# EAGLE design motortester (EAGLE 9.6.0)
REVISION: v1.0; TEAM: RoboCup SSL

## Sheet 1 of 2: Microcontroller and connectors
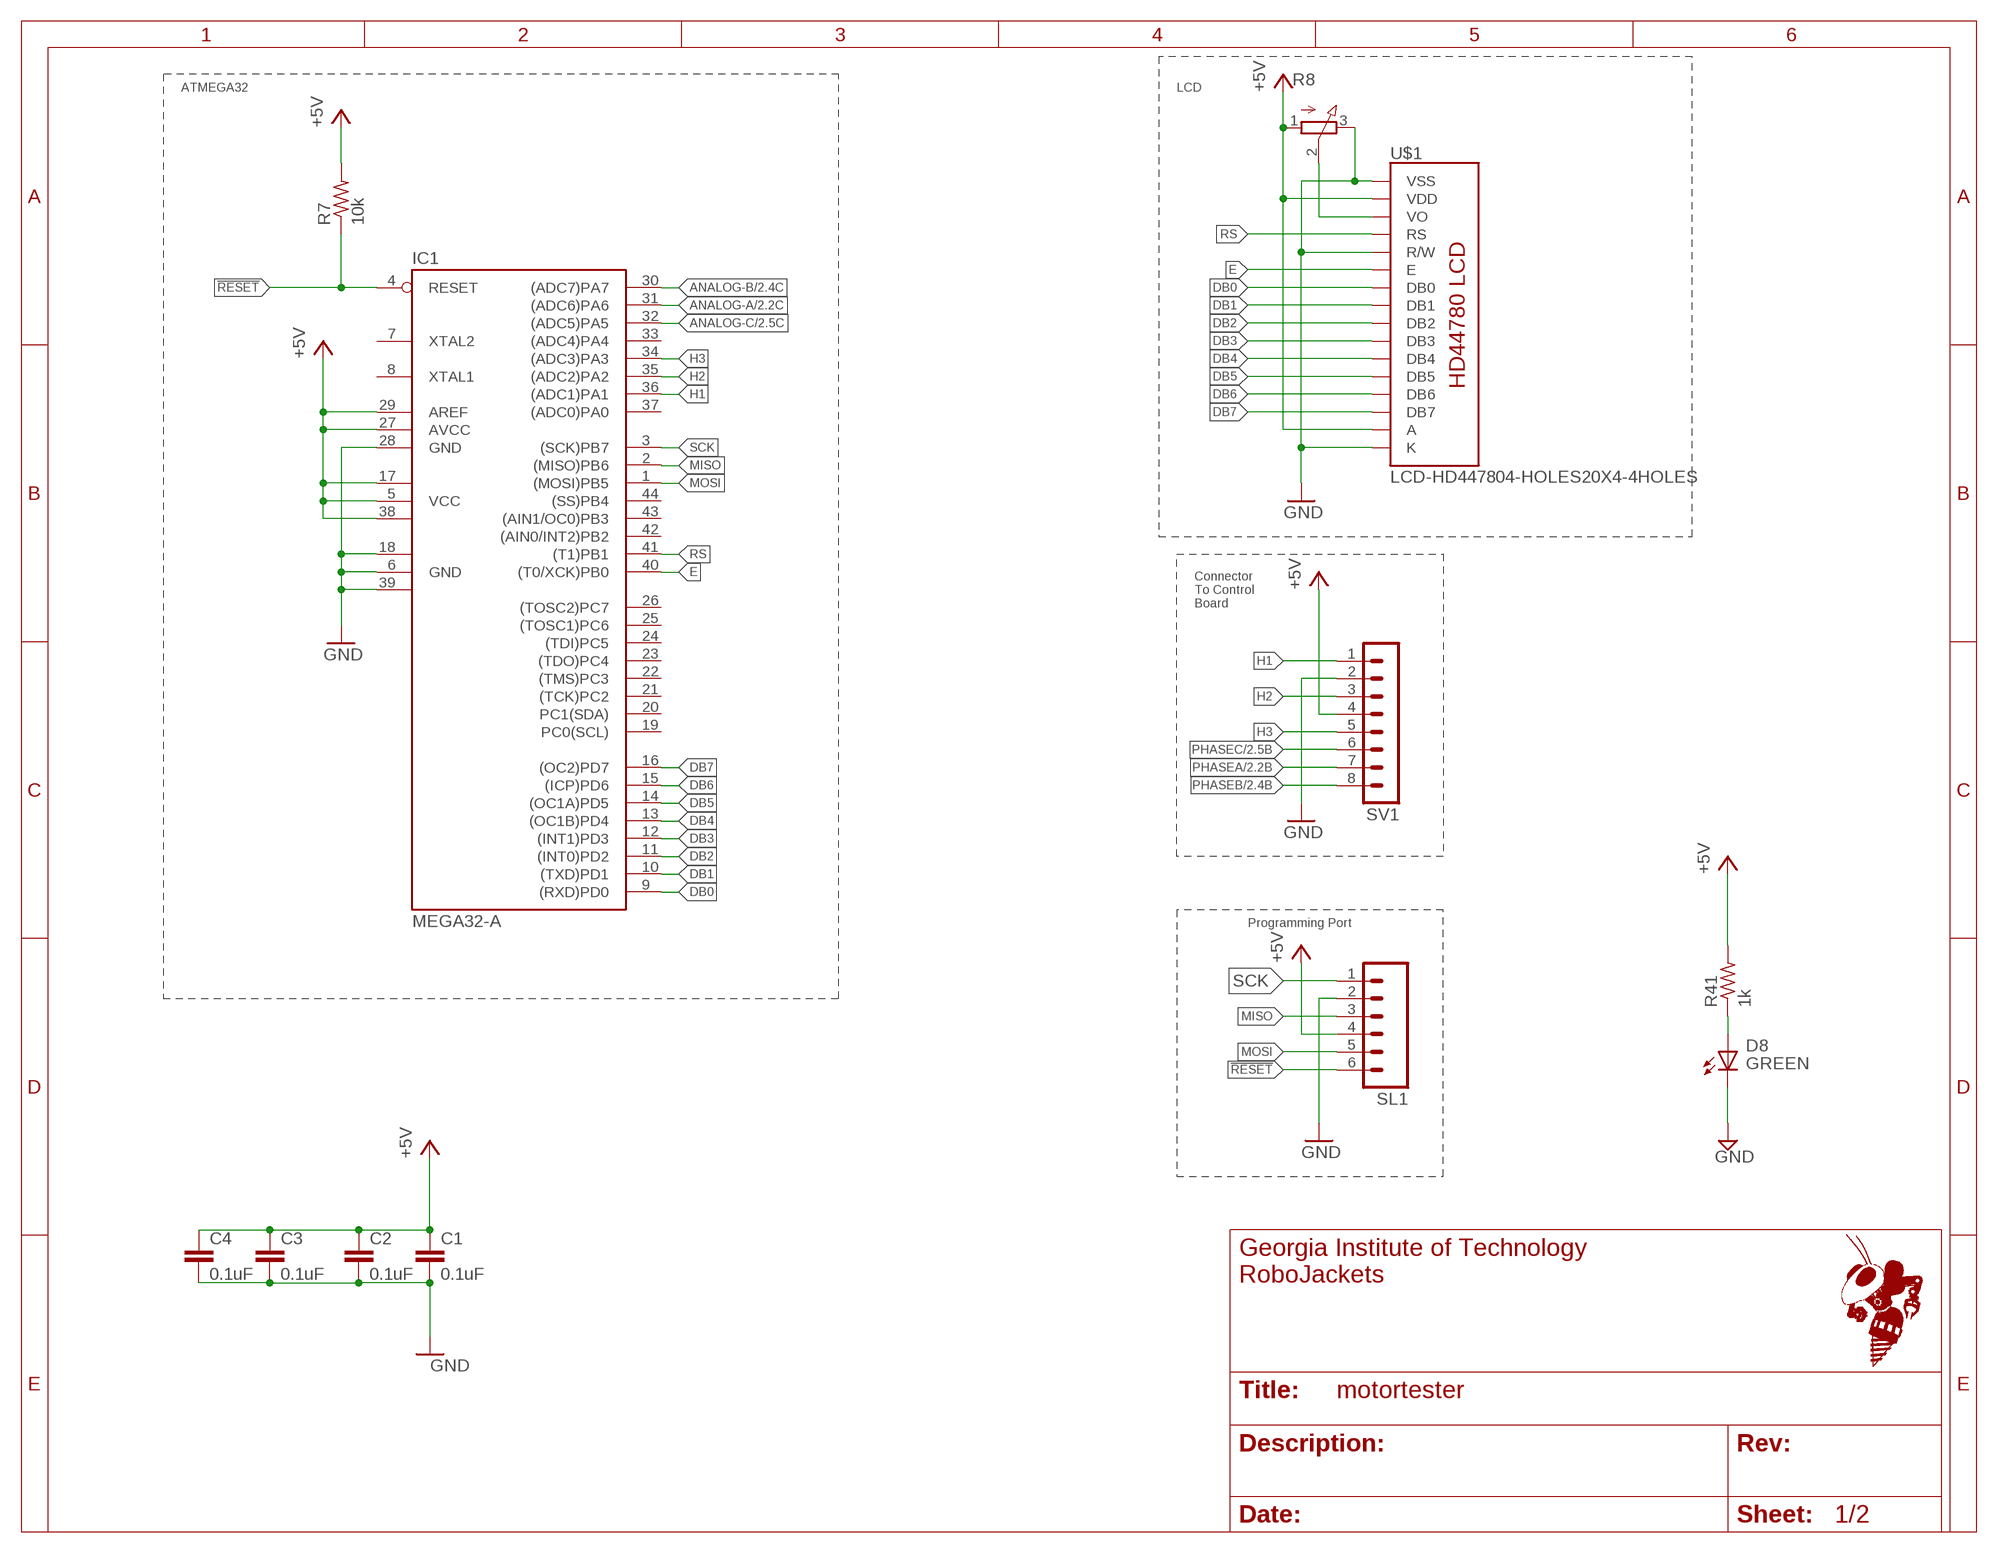
[diagram p0: schematic, sheet 1]

### Parts
C1  0.1uF  C-EUC0603  [C0603]
C2  0.1uF  C-EUC0603  [C0603]
C3  0.1uF  C-EUC0603  [C0603]
C4  0.1uF  C-EUC0603  [C0603]
D8  GREEN  LED-SMD-GREEN  [CHIP-LED0603]
IC1  MEGA32-A  [TQFP44]
R7  10k  R-US_R0603  [R0603]
R8  3RP/1610N  [3RP/1610N]
R41  1k  R-US_R0603  [R0603]
SL1  M06  [06P]
SV1  MA08-1  [MA08-1]
U$1  LCD-HD447804-HOLES20X4-4HOLES  [LCD-20X4-4HOLES]

### Nets
5V_PWR_BR: D8.A R41.1
!RESET!: IC1.4(RESET) R7.1 SL1.6
ANALOG-A: IC1.31((ADC6)PA6) ; also sheet 2
ANALOG-B: IC1.30((ADC7)PA7) ; also sheet 2
ANALOG-C: IC1.32((ADC5)PA5) ; also sheet 2
DB0: IC1.9((RXD)PD0) U$1.P$7(DB0)
DB1: IC1.10((TXD)PD1) U$1.P$8(DB1)
DB2: IC1.11((INT0)PD2) U$1.P$9(DB2)
DB3: IC1.12((INT1)PD3) U$1.P$10(DB3)
DB4: IC1.13((OC1B)PD4) U$1.P$11(DB4)
DB5: IC1.14((OC1A)PD5) U$1.P$12(DB5)
DB6: IC1.15((ICP)PD6) U$1.P$13(DB6)
DB7: IC1.16((OC2)PD7) U$1.P$14(DB7)
E: IC1.40((T0/XCK)PB0) U$1.P$6(E)
GND: C1.2 C2.2 C3.2 C4.2 D8.C(K) IC1.6(GND) IC1.18(GND1) IC1.28(GND) IC1.39(GND2) R8.3(E) SL1.2 SV1.2 U$1.P$1(VSS) U$1.P$5(R/W) U$1.P$16(K)
H1: IC1.36((ADC1)PA1) SV1.1
H2: IC1.35((ADC2)PA2) SV1.3
H3: IC1.34((ADC3)PA3) SV1.5
MISO: IC1.2((MISO)PB6) SL1.3
MOSI: IC1.1((MOSI)PB5) SL1.5
N$4: R8.2(S) U$1.P$3(VO)
PHASEA: SV1.7 ; also sheet 2
PHASEB: SV1.8 ; also sheet 2
PHASEC: SV1.6 ; also sheet 2
RS: IC1.41((T1)PB1) U$1.P$4(RS)
SCK: IC1.3((SCK)PB7) SL1.1
VCC: C1.1 C2.1 C3.1 C4.1 IC1.5(VCC) IC1.17(VCC1) IC1.27(AVCC) IC1.29(AREF) IC1.38(VCC2) R7.2 R8.1(A) R41.2 SL1.4 SV1.4 U$1.P$2(VDD) U$1.P$15(A) ; supply symbol labelled +5V ; also sheet 2
Unconnected: IC1.7(XTAL2) IC1.8(XTAL1) IC1.19(PC0(SCL)) IC1.20(PC1(SDA)) IC1.21((TCK)PC2) IC1.22((TMS)PC3) IC1.23((TDO)PC4) IC1.24((TDI)PC5) IC1.25((TOSC1)PC6) IC1.26((TOSC2)PC7) IC1.33((ADC4)PA4) IC1.37((ADC0)PA0) IC1.42((AIN0/INT2)PB2) IC1.43((AIN1/OC0)PB3) IC1.44((SS)PB4)

### Notes on the sheet
- ATMEGA32 | LCD
- Connector
  To Control
  Board
- Programming Port

## Sheet 2 of 2: Resistor network
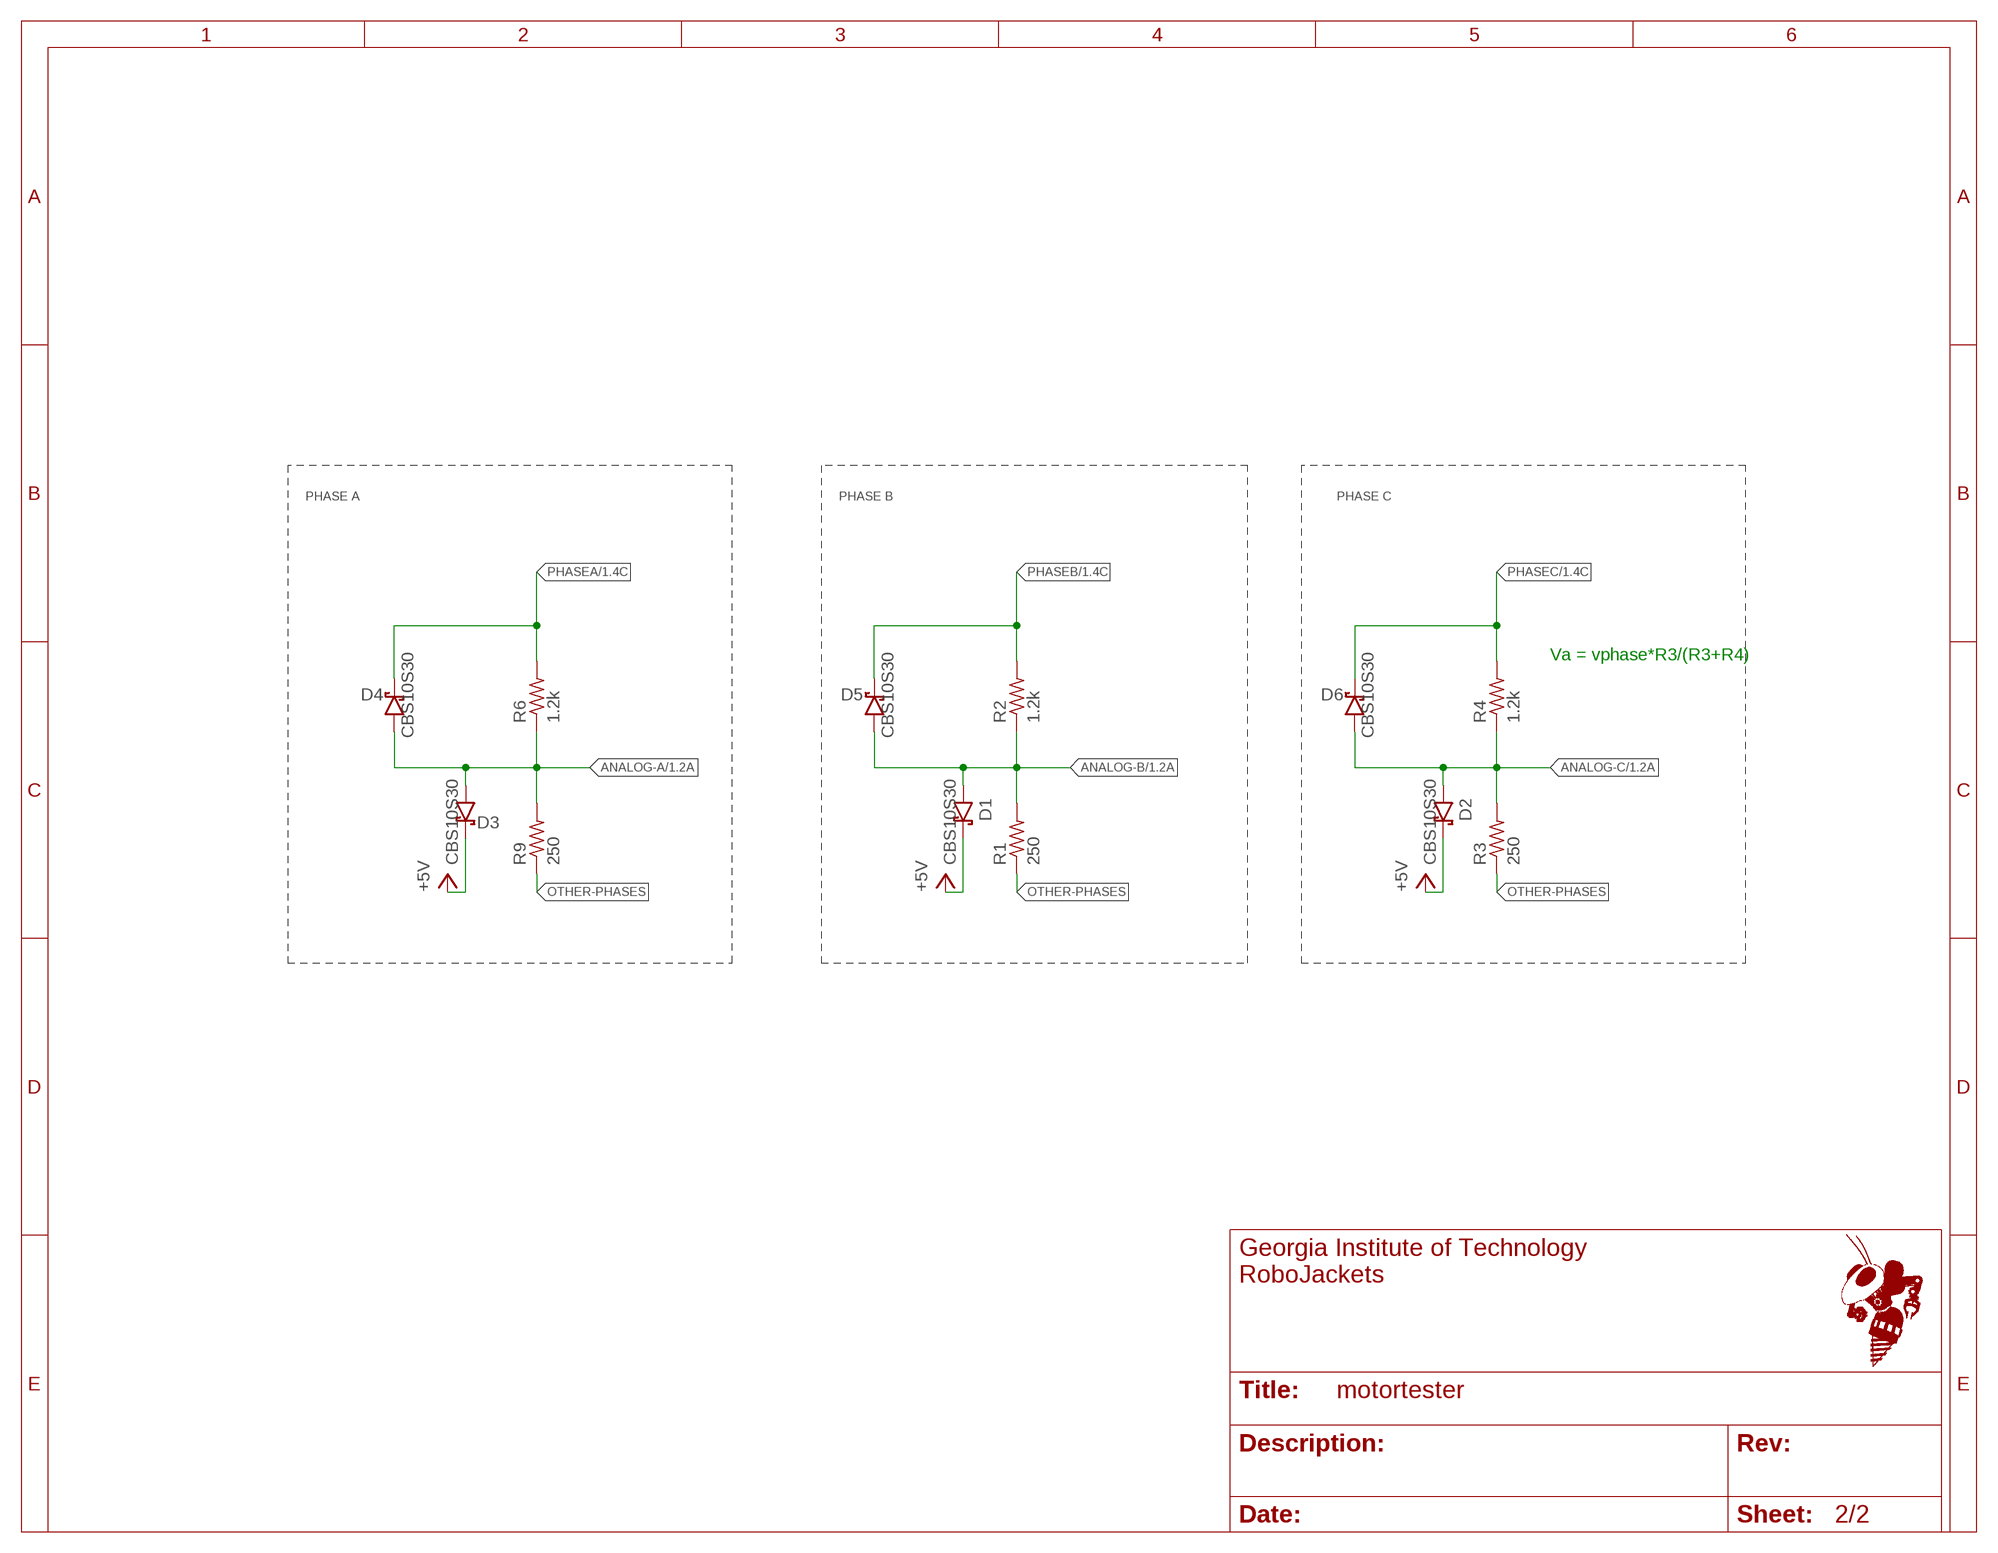
[diagram p1: schematic, sheet 2]

### Parts
D1  CBS10S30  [CST2B]
D2  CBS10S30  [CST2B]
D3  CBS10S30  [CST2B]
D4  CBS10S30  [CST2B]
D5  CBS10S30  [CST2B]
D6  CBS10S30  [CST2B]
R1  250  R-US_R0603  [R0603]
R2  1.2k  R-US_R1206  [R1206]
R3  250  R-US_R0603  [R0603]
R4  1.2k  R-US_R1206  [R1206]
R6  1.2k  R-US_R1206  [R1206]
R9  250  R-US_R0603  [R0603]

### Nets
ANALOG-A: D3.A D4.A R6.1 R9.2 ; also sheet 1
ANALOG-B: D1.A D5.A R1.2 R2.1 ; also sheet 1
ANALOG-C: D2.A D6.A R3.2 R4.1 ; also sheet 1
OTHER-PHASES: R1.1 R3.1 R9.1
PHASEA: D4.K(C) R6.2 ; also sheet 1
PHASEB: D5.K(C) R2.2 ; also sheet 1
PHASEC: D6.K(C) R4.2 ; also sheet 1
VCC: D1.K(C) D2.K(C) D3.K(C) ; supply symbol labelled +5V ; also sheet 1

### Notes on the sheet
- PHASE A | PHASE B | PHASE C
- Va = vphase*R3/(R3+R4)

## Library data of the parts
C1-C4 = rcl:C-EU: CAPACITOR, European symbol; SPICEPREFIX: C
D1-D6 = RoboJackets-Diodes:CBS10S30
D8 = RoboJackets-LEDs:LED-SMD; DIGIKEY: 160-1446-1-ND; MPN: LTST-C191KGKT
IC1 = atmel:MEGA32: MICROCONTROLLER 32 Kbytes FLASH 2 Kbytes SRAM 1 Kbytes EEPROM USART 8-channel 10 bit ADC Source: www.atmel.com .. doc2503.pdf; MPN: ATMEGA32-16AU; OC_FARNELL: 9171274; OC_NEWARK: 69K6677
R1-R4 R6 R7 R9 = rcl:R-US_: RESISTOR, American symbol; SPICEPREFIX: R
R8 = pot:3RP/1610N: 16mm Potentiometer one level Source: http://www.alphapotentiometers.net/html/16mm_pot_2.html
R41 = rcl:R-US_: RESISTOR, American symbol
SL1 = con-amp-quick:M06: AMP QUICK CONNECTOR; OC_FARNELL: unknown; OC_NEWARK: unknown
SV1 = con-lstb:MA08-1: PIN HEADER; OC_FARNELL: unknown; OC_NEWARK: unknown
U$1 = HD44780LCD:LCD-HD44780

## Board
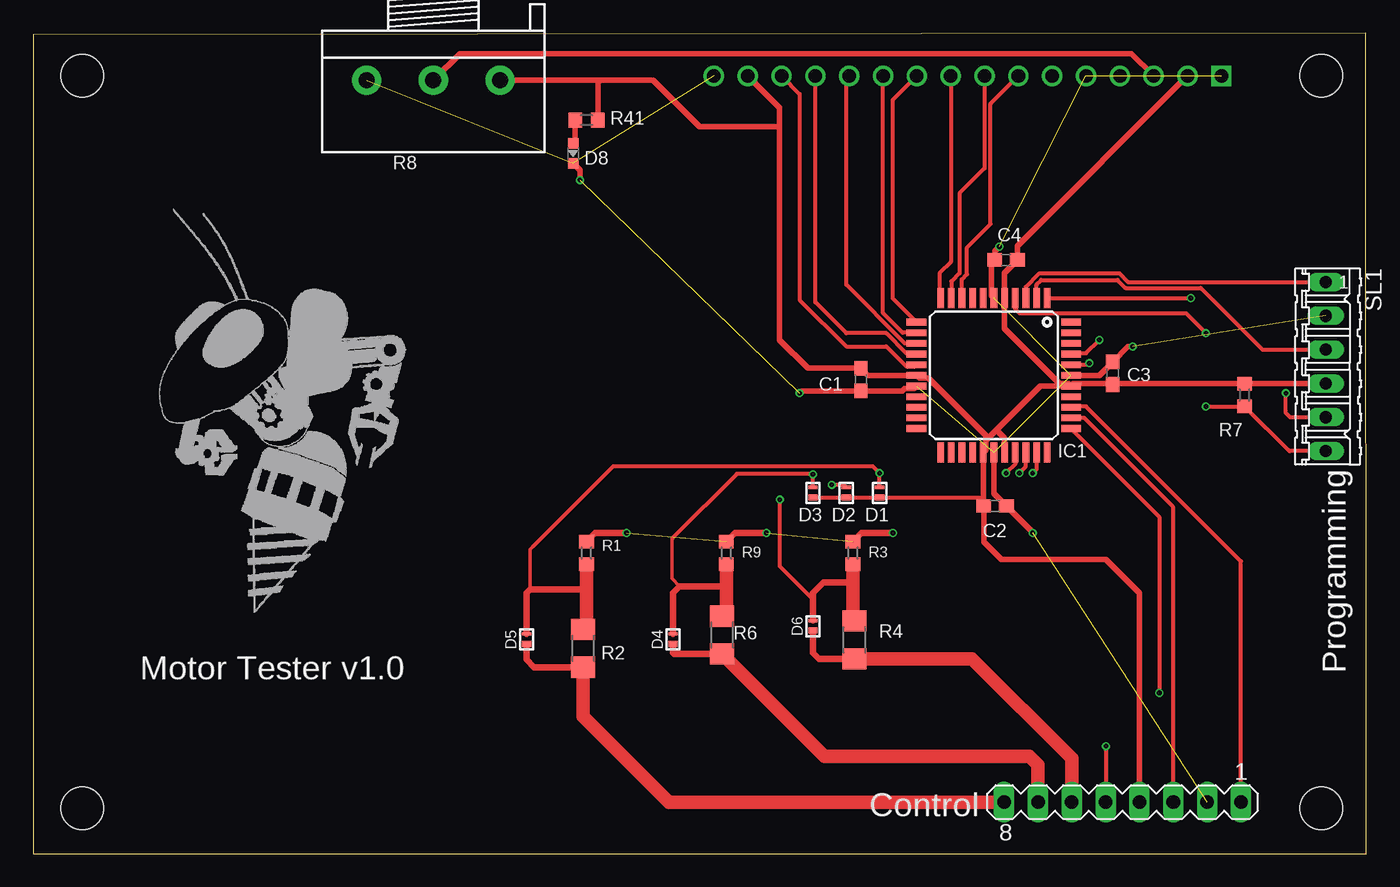
[diagram p2: board, top side]
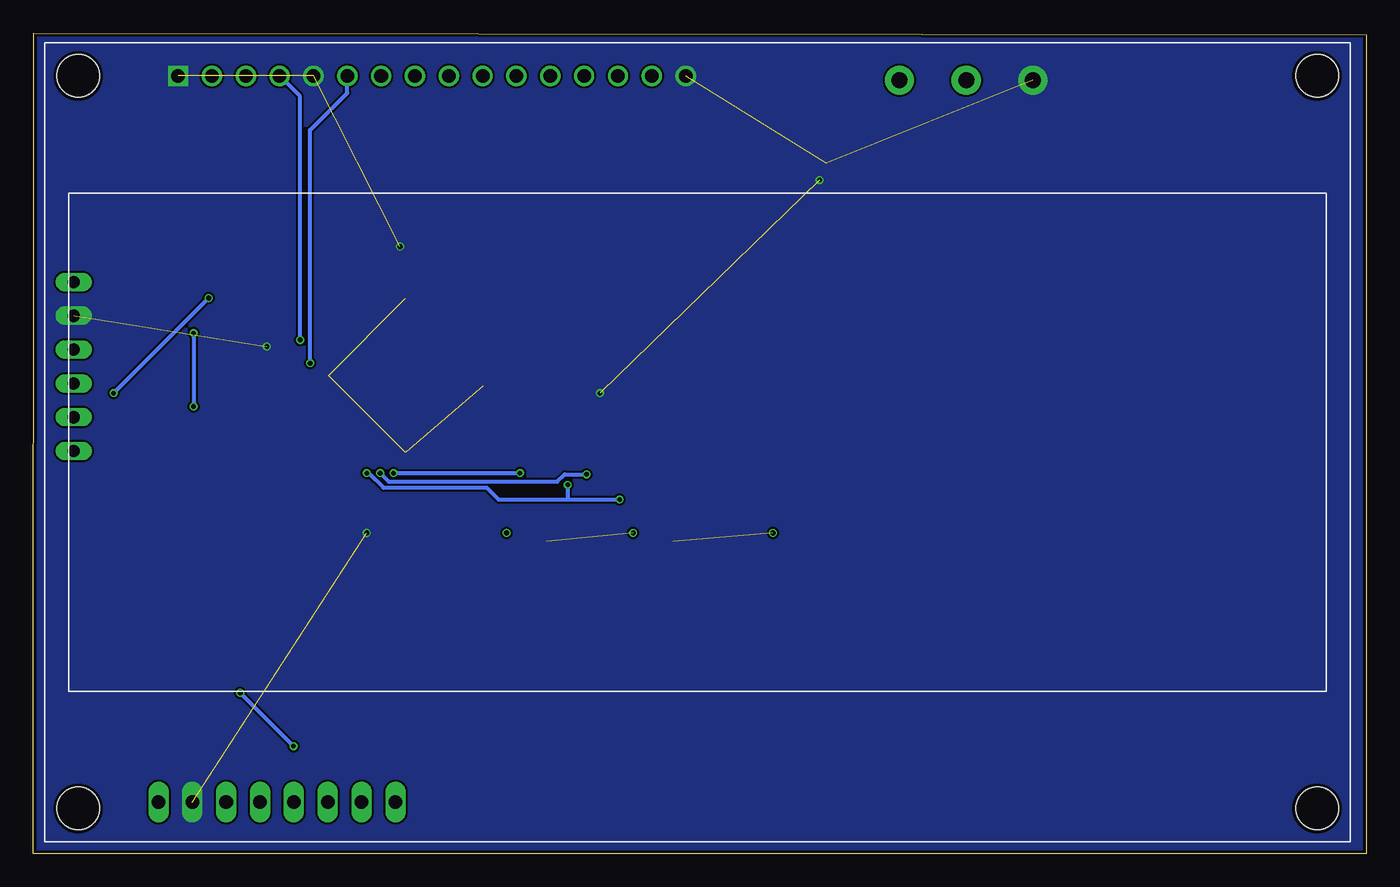
[diagram p3: board, bottom side, seen from below]

Size 100.06 x 61.59 mm. Coordinates in mm from the lower left corner, seen from the top.
Outline: 0,0 100.06,0 100.01,61.59 0,61.49 0,0
Copper layers (1*16): Top 0.018mm / dielectric 1.55mm / Bottom 0.018mm
Design rules "eC_2Layer_PClass6_BaseCopperO18_eCDefault": minimum track width 0.15mm, minimum drill 0.35mm, track to track 0.15mm, track to pad 0.15mm, pad to pad 0.15mm, via to via 0.15mm, smd to smd 0mil, copper to edge 0.25mm, drill to drill 0.35mm, minimum pad ring 0.175mm, minimum via ring 0.125mm, stop-mask expansion 0mil, vias tented up to drill 0.45mm, thermal gap 0.2mm

### Footprints (pad centres in the part's own frame; a part is rotated, then mirrored left to right if it is on the bottom)
C0603 = smd 1.1 x 1: 1 -0.85,0; 2 0.85,0
CST2B = smd 0.7 x 0.25: A 0,0.425 | smd 0.7 x 0.45: K 0,-0.325
CHIP-LED0603 = smd 0.8 x 0.8: A 0,-0.75; C 0,0.75
TQFP44 = smd 1.5 x 0.5: 1 -5.8,4; 2 -5.8,3.2; 3 -5.8,2.4; 4 -5.8,1.6; 5 -5.8,0.8; 6 -5.8,0; 7 -5.8,-0.8; 8 -5.8,-1.6; 9 -5.8,-2.4; 10 -5.8,-3.2; 11 -5.8,-4; 23 5.8,-4; 24 5.8,-3.2; 25 5.8,-2.4; 26 5.8,-1.6; 27 5.8,-0.8; 28 5.8,0; 29 5.8,0.8; 30 5.8,1.6; 31 5.8,2.4; 32 5.8,3.2; 33 5.8,4 | smd 0.5 x 1.5: 12 -4,-5.8; 13 -3.2,-5.8; 14 -2.4,-5.8; 15 -1.6,-5.8; 16 -0.8,-5.8; 17 0,-5.8; 18 0.8,-5.8; 19 1.6,-5.8; 20 2.4,-5.8; 21 3.2,-5.8; 22 4,-5.8; 34 4,5.8; 35 3.2,5.8; 36 2.4,5.8; 37 1.6,5.8; 38 0.8,5.8; 39 0,5.8; 40 -0.8,5.8; 41 -1.6,5.8; 42 -2.4,5.8; 43 -3.2,5.8; 44 -4,5.8
R0603 = smd 1 x 1.1: 1 -0.85,0; 2 0.85,0
R1206 = smd 1.6 x 1.803: 1 -1.422,0; 2 1.422,0
3RP/1610N = drill 1.2 pad 2.184: 1 -5,0; 2 0,0; 3 5,0
06P = drill 0.914 long: 1 -6.35,0; 2 -3.81,0; 3 -1.27,0; 4 1.27,0; 5 3.81,0; 6 6.35,0
MA08-1 = drill 1.016 long: 1 -8.89,0; 2 -6.35,0; 3 -3.81,0; 4 -1.27,0; 5 1.27,0; 6 3.81,0; 7 6.35,0; 8 8.89,0
LCD-20X4-4HOLES = drill 1.016 square: P$1 10,57.5 | drill 1.016: P$2 12.54,57.5; P$3 15.08,57.5; P$4 17.62,57.5; P$5 20.16,57.5; P$6 22.7,57.5; P$7 25.24,57.5; P$8 27.78,57.5; P$9 30.32,57.5; P$10 32.86,57.5; P$11 35.4,57.5; P$12 37.94,57.5; P$13 40.48,57.5; P$14 43.02,57.5; P$15 45.56,57.5; P$16 48.1,57.5 | hole 3.2: 2.5,2.5; 2.5,57.5; 95.5,57.5; 95.5,2.5

### Placement (x,y rotation side)
C1  62.12,35.59 270 top
C2  72.2,26.09 0 top
C3  81.03,36.07 90 top
C4  73.03,44.57 180 top
D1  63.53,27.07 0 top
D2  61.03,27.07 0 top
D3  58.53,27.07 0 top
D4  48.03,16.07 0 top
D5  37.03,16.07 0 top
D6  58.53,17.07 0 top
D8  40.53,52.57 180 top
IC1  72.11,35.91 270 top
R1  41.53,22.57 270 top
R2  41.28,15.41 270 top
R3  61.53,22.57 270 top
R4  61.64,16.04 270 top
R6  51.71,16.41 270 top
R7  90.92,34.43 90 top
R8  30.03,58.07 180 top
R9  52.03,22.57 270 top
R41  41.53,55.07 0 top
SL1  97.03,36.57 270 top
SV1  81.77,3.86 180 top
U$1  99.19,0.89 0 bottom
U$2  [ROBOBUZZ_1.4X]  16.53,18.07 0 top

### Tracks (layer width: path | path; a pad name or v marks a point on that pad's centre or on a via)
5V_PWR_BR
  Top 0.4: R41.1 40.68,53.47 D8.A
!RESET!  (via drill 0.35)
  Top 0.3: IC1.4 73.7,40.89 74.03,40.57 86.53,40.57 v88.03,39.07 | SL1.6 94.29,30.22 R7.1 88.04,33.58 v88.03,33.57
  Bottom 0.3: v88.03,39.07 v88.03,33.57
ANALOG-A  (via drill 0.35)
  Top 0.25: 47.95,23.65 47.95,20.65 48.53,20.07
  Top 0.3: v74.03,28.57 74.5,29.05 IC1.31 | 47.95,23.65 52.81,28.51 58.49,28.51 v58.53,28.47 D3.A
  Top 0.5: D4.A 48.03,19.57 48.53,20.07 52.03,20.07
  Top 1: R9.2 52.03,20.07 52.03,18.15 R6.1
  Bottom 0.3: v74.03,28.57 73.38,27.92 60.73,27.92 60.18,28.47 v58.53,28.47
ANALOG-B  (via drill 0.35)
  Top 0.25: 37.53,23.07 37.3,22.84 37.3,19.84
  Top 0.3: IC1.30 73.7,29.25 v73.03,28.57 | D1.A v63.53,28.57 63.03,29.07 43.53,29.07 37.53,23.07
  Top 0.5: D5.A 37.03,19.57 37.3,19.84 41.25,19.84 41.53,19.57
  Top 1: R2.1 41.53,17.08 41.53,19.57 R1.2
  Bottom 0.3: v73.03,28.57 v63.53,28.57
ANALOG-C  (via drill 0.35)
  Top 0.3: IC1.32 75.31,28.85 v75.03,28.57 | 58.53,19.08 56.03,21.57 v56.03,26.57 | D2.A 60.84,27.69 v59.94,27.69
  Top 0.5: D6.A 58.53,19.08 58.53,19.57 59.3,20.34 61.25,20.34 61.53,20.07
  Top 1: R3.2 61.53,20.07 61.53,17.58 R4.1
  Bottom 0.3: v75.03,28.57 74.88,28.57 73.78,27.47 66.03,27.47 65.13,26.57 59.94,26.57 | 59.94,26.57 v56.03,26.57 | v59.94,27.69 59.94,26.57
DB0
  Top 0.3: IC1.9 69.7,43.11 70.09,43.5 70.09,45.5 71.86,47.26 71.86,56.3 U$1.P$7
DB1
  Top 0.3: U$1.P$8 71.41,51.45 69.53,49.57 69.53,43.57 68.91,42.95 IC1.10
DB2
  Top 0.3: U$1.P$9 68.87,44.41 68.03,43.57 68.03,41.79 IC1.11
DB3
  Top 0.3: IC1.12 64.53,41.69 64.53,56.59 U$1.P$10
DB4
  Top 0.3: IC1.13 65.26,39.11 63.79,40.58 U$1.P$11
DB5
  Top 0.3: IC1.14 65.42,38.31 61.03,42.7 61.03,58.17 U$1.P$12
DB6
  Top 0.3: IC1.15 65.59,37.51 64.03,39.07 61.03,39.07 58.71,41.39 U$1.P$13
DB7
  Top 0.3: U$1.P$14 57.53,57.03 57.53,41.57 61.03,38.07 64.03,38.07 65.53,36.57 66.17,36.57 IC1.16
E  (via drill 0.35)
  Top 0.3: IC1.40 79.17,36.71 v79.28,36.82
  Bottom 0.3: v79.28,36.82 79.28,54.32 76.49,57.11 U$1.P$6
GND  (via drill 0.35)  (10 unrouted)
  Top 0.4: IC1.18 66.11,34.91 65.41,34.91 65.25,34.74 C1.2 57.7,34.74 v57.53,34.57 | IC1.28 72.11,27.04 C2.2 75.03,24.11 v75.03,24.07 | IC1.39 80.02,35.91 C3.2 82.18,38.07 v82.53,38.07 | IC1.6 71.91,41.91 71.91,44.3 C4.2 72.18,45.22 v72.53,45.57 | D8.C 41.03,51.32 v41.03,50.57
  pour Bottom (no thermals): 0.03,61.57 100.03,61.57 100.03,0.07 0.03,0.07
H1
  Top 0.3: SV1.1 90.66,21.94 79.03,33.57 77.97,33.57 IC1.36
H2
  Top 0.3: SV1.3 85.58,26.02 78.89,32.71 IC1.35
H3  (via drill 0.35)
  Top 0.3: IC1.34 84.53,25.29 v84.53,12.07 | v80.53,8.07 80.53,3.89 SV1.5
  Bottom 0.3: v84.53,12.07 v80.53,8.07
MISO
  Top 0.3: IC1.2 75.31,42.71 75.66,43.07 81.39,43.07 81.99,42.47 87.63,42.47 92.26,37.84 SL1.3
MOSI  (via drill 0.35)
  Top 0.3: IC1.1 v86.89,41.71 | v94.03,34.57 94.03,33.07 94.34,32.76 SL1.5
  Bottom 0.3: v94.03,34.57 v86.89,41.71
N$4
  Top 0.4: U$1.P$3 82.43,60.07 32.03,60.07 R8.2
OTHER-PHASES  (via drill 0.35)  (2 unrouted)
  Top 0.5: R1.1 42.18,24.07 v44.53,24.07 | R9.1 52.68,24.07 v55.03,24.07 | R3.1 62.18,24.07 v64.53,24.07
PHASEA
  Top 0.5: D4.K 48.03,15.07 48.1,14.99 R6.2
  Top 1: SV1.7 75.42,6.68 74.78,7.32 59.39,7.32 R6.2
PHASEB
  Top 0.5: D5.K 37.03,14.57 37.6,13.99 R2.2
  Top 1: R2.2 41.28,10.31 47.74,3.86 SV1.8
PHASEC
  Top 0.5: D6.K 58.53,15.07 58.98,14.62 R4.2
  Top 1: SV1.6 77.96,7.14 70.48,14.62 R4.2
RS  (via drill 0.35)
  Top 0.3: IC1.41 77.97,37.57 79.03,37.57 v80.03,38.57
  Bottom 0.3: U$1.P$4 80.03,56.85 v80.03,38.57
SCK
  Top 0.3: IC1.3 74.5,42.55 75.53,43.57 81.53,43.57 82.18,42.92 SL1.1
VCC
  Top 0.3: D3.K D2.K D1.K 71.25,26.74 71.31,26.8
  Top 0.4: SL1.4 90.94,35.3 R7.2 81.09,35.28 C3.1 80.96,35.28 78.08,35.28 IC1.38 | SV1.4 83.04,19.56 80.53,22.07 72.68,22.07 71.35,23.4 C2.1 71.31,26.14 71.31,26.8 IC1.27 71.5,30.31 71.5,31 | U$1.P$15 56.03,55.99 56.03,54.57 | 56.03,54.57 56.03,38.57 58.15,36.44 C1.1 62.66,35.91 IC1.17 66.5,35.71 67.2,35.71 71.5,31.4 71.5,31 | IC1.38 77.7,35.31 77.01,35.31 72.91,39.41 IC1.5 72.91,43.6 C4.1 73.88,45.62 U$1.P$2 | 71.5,31 72.3,31.8 | 72.3,31.8 75.61,35.11 IC1.38 | R8.1 42.53,58.07 | 42.53,58.07 46.53,58.07 50.03,54.57 56.03,54.57 | IC1.29 72.91,31.19 72.3,31.8 | R41.2 42.38,57.92 42.53,58.07

### Text on the board
tNames: Programming | Motor Tester v1.0 | Control